# Altium schematic sheet DEMOD_FILTERS.SchDoc
size A; SheetNumber: 4; SheetTotal: 9
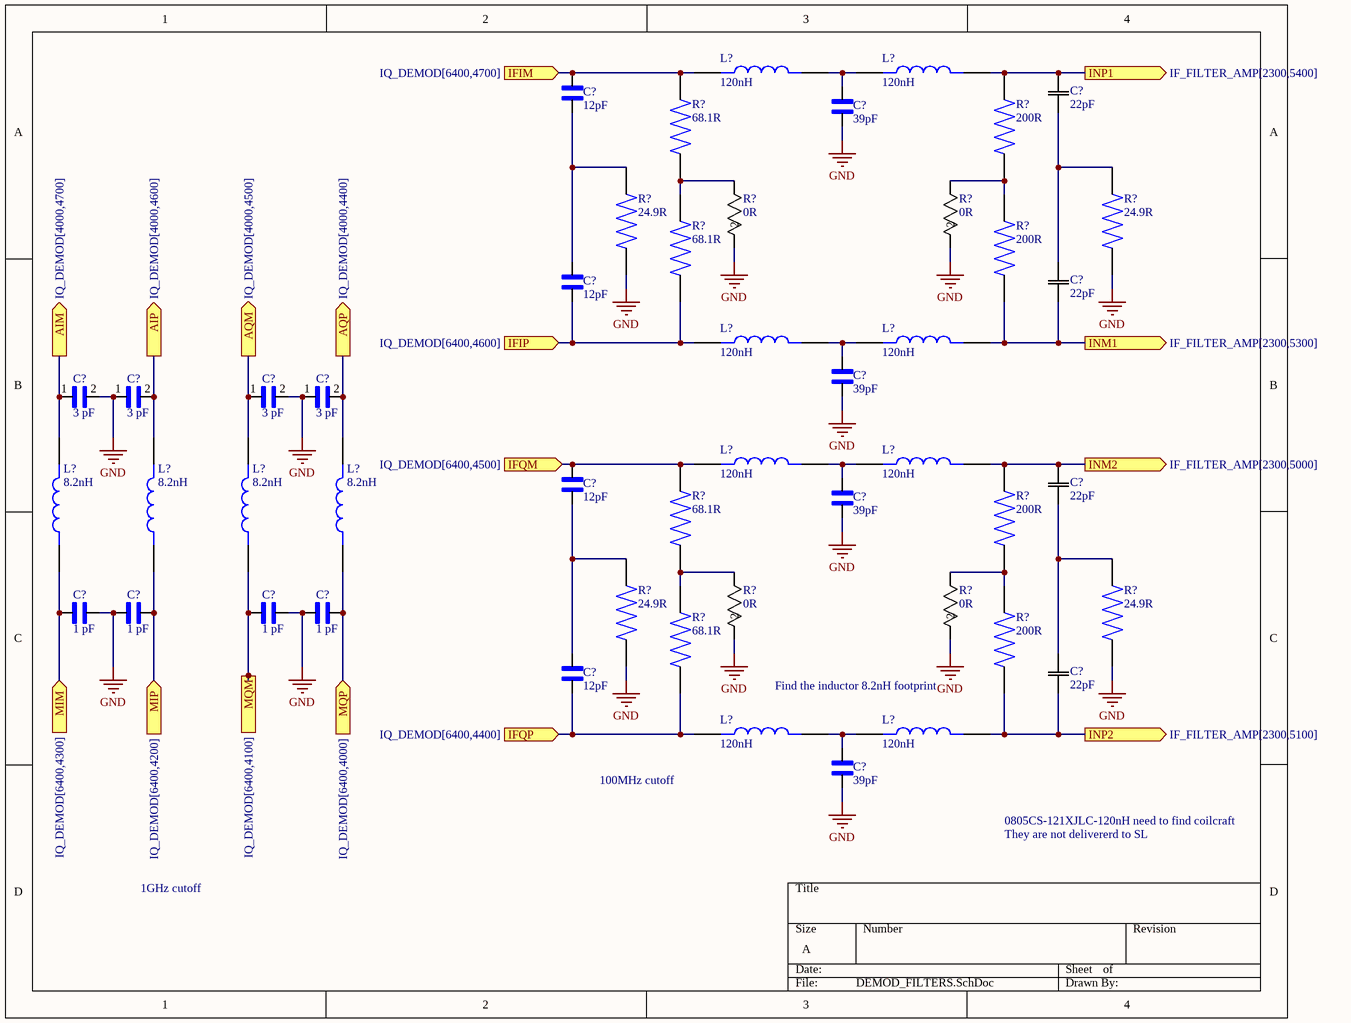
[diagram p0: DEMOD_FILTERS.SchDoc]

## Parts
(Parts that share a designator on the sheet are numbered #1, #2 ... from top to bottom, then left to right.)
C?#1  12pF  [CAPC1005X55N]
C?#2  39pF  [CAPC1005X55N]
C?#3  22pF  [G-155_MUR]
C?#4  12pF  [CAPC1005X55N]
C?#5  22pF  [G-155_MUR]
C?#6  39pF  [CAPC1005X55N]
C?#7  3 pF  [CAPC0603X33N]
C?#8  3 pF  [CAPC0603X33N]
C?#9  3 pF  [CAPC0603X33N]
C?#10  3 pF  [CAPC0603X33N]
C?#11  12pF  [CAPC1005X55N]
C?#12  39pF  [CAPC1005X55N]
C?#13  22pF  [G-155_MUR]
C?#14  1 pF  [CAPC0603X33N]
C?#15  1 pF  [CAPC0603X33N]
C?#16  1 pF  [CAPC0603X33N]
C?#17  1 pF  [CAPC0603X33N]
C?#18  12pF  [CAPC1005X55N]
C?#19  22pF  [G-155_MUR]
C?#20  39pF  [CAPC1005X55N]
L?#1  120nH
L?#2  120nH
L?#3  120nH
L?#4  120nH
L?#5  120nH
L?#6  120nH
L?#7  8.2nH
L?#8  8.2nH
L?#9  8.2nH
L?#10  8.2nH
L?#11  120nH
L?#12  120nH
R?#1  68.1R  [RESC1005X40N]
R?#2  200R  [RESC1005X40N]
R?#3  24.9R  [RESC1005X40N]
R?#4  24.9R  [RESC1005X40N]
R?#5  68.1R  [RESC1005X40N]
R?#6  0R  [RC0402N_PAN]
R?#7  0R  [RC0402N_PAN]
R?#8  200R  [RESC1005X40N]
R?#9  68.1R  [RESC1005X40N]
R?#10  200R  [RESC1005X40N]
R?#11  24.9R  [RESC1005X40N]
R?#12  24.9R  [RESC1005X40N]
R?#13  68.1R  [RESC1005X40N]
R?#14  0R  [RC0402N_PAN]
R?#15  0R  [RC0402N_PAN]
R?#16  200R  [RESC1005X40N]

## Ports
AIM (out, see IQ_DEMOD[4000,4700]), AIP (out, see IQ_DEMOD[4000,4600]), AQM (out, see IQ_DEMOD[4000,4500]), AQP (out, see IQ_DEMOD[4000,4400]), IFIM (in, see IQ_DEMOD[6400,4700]), IFIP (in, see IQ_DEMOD[6400,4600]), IFQM (in, see IQ_DEMOD[6400,4500]), IFQP (in, see IQ_DEMOD[6400,4400]), INM1 (out, see IF_FILTER_AMP[2300,5300]), INM2 (out, see IF_FILTER_AMP[2300,5000]), INP1 (out, see IF_FILTER_AMP[2300,5400]), INP2 (out, see IF_FILTER_AMP[2300,5100]), MIM (in, see IQ_DEMOD[6400,4300]), MIP (in, see IQ_DEMOD[6400,4200]), MQM (in, see IQ_DEMOD[6400,4100]), MQP (in, see IQ_DEMOD[6400,4000])

## Nets
GND: C?#2.1 C?#6.1 C?#7.2 C?#8.1 C?#9.2 C?#10.1 C?#12.1 C?#14.2 C?#15.1 C?#16.2 C?#17.1 C?#20.1 R?#3.1 R?#4.1 R?#6.2 R?#7.2 R?#11.1 R?#12.1 R?#14.2 R?#15.2
AIM: C?#7.1 L?#7.2 ; port AIM
AIP: C?#8.2 L?#8.2 ; port AIP
AQM: C?#9.1 L?#9.2 ; port AQM
AQP: C?#10.2 L?#10.2 ; port AQP
IFIM: C?#1.2 L?#1.1 R?#1.2 ; port IFIM
IFIP: C?#4.1 L?#3.1 R?#5.1 ; port IFIP
IFQM: C?#11.2 L?#5.1 R?#9.2 ; port IFQM
IFQP: C?#18.1 L?#11.1 R?#13.1 ; port IFQP
INM1: C?#5.1 L?#4.2 R?#8.1 ; port INM1
INM2: C?#13.2 L?#6.2 R?#10.2 ; port INM2
INP1: C?#3.2 L?#2.2 R?#2.2 ; port INP1
INP2: C?#19.1 L?#12.2 R?#16.1 ; port INP2
MIM: C?#14.1 L?#7.1 ; port MIM
MIP: C?#15.2 L?#8.1 ; port MIP
MQM: C?#16.1 L?#9.1 ; port MQM
MQP: C?#17.2 L?#10.1 ; port MQP
NetC?#1_1: C?#1.1 C?#4.2 R?#3.2
NetC?#2_2: C?#2.2 L?#1.2 L?#2.1
NetC?#3_1: C?#3.1 C?#5.2 R?#4.2
NetC?#6_2: C?#6.2 L?#3.2 L?#4.1
NetC?#11_1: C?#11.1 C?#18.2 R?#11.2
NetC?#12_2: C?#12.2 L?#5.2 L?#6.1
NetC?#13_1: C?#13.1 C?#19.2 R?#12.2
NetC?#20_2: C?#20.2 L?#11.2 L?#12.1
NetR?#1_1: R?#1.1 R?#5.2 R?#6.1
NetR?#2_1: R?#2.1 R?#7.1 R?#8.2
NetR?#9_1: R?#9.1 R?#13.2 R?#14.1
NetR?#10_1: R?#10.1 R?#15.1 R?#16.2

## Notes on the sheet
- Find the inductor 8.2nH footprint
- 100MHz cutoff
- 0805CS-121XJLC-120nH need to find coilcraft
- They are not delivererd to SL
- 1GHz cutoff

## Library data of the parts
C?#1 C?#4 C?#11 C?#18 = GRM1555C1H120JA01D-12p: SMD Capacitor C0G(EIA) with Capacitance: 12pF Tol. 5%. Rated Voltage: 50Vdc; MF: Murata; SnapEDA_Link: https://www.snapeda.com/parts/GRM1555C1H120JA01D/Murata/view-part/?ref=snap; Package: 1005-2 Murata; Value: *; MP: GRM1555C1H120JA01D; Check_prices: https://www.snapeda.com/parts/GRM1555C1H120JA01D/Murata/view-part/?ref=eda
C?#2 C?#6 C?#12 C?#20 = GRM1555C1H390JA01D-39p: SMD Capacitor C0G(EIA) with Capacitance: 39pF Tol. 5%. Rated Voltage: 50Vdc; MF: Murata; SnapEDA_Link: https://www.snapeda.com/parts/GRM1555C1H390JA01D/Murata/view-part/?ref=snap; Package: 1005-2 Murata; Value: *; MP: GRM1555C1H390JA01D; Check_prices: https://www.snapeda.com/parts/GRM1555C1H390JA01D/Murata/view-part/?ref=eda
C?#3 C?#5 C?#13 C?#19 = GRM1555C1H220JA01D-22p: Description; Manufacturer_Name: Murata; Copyright: Copyright (C) 2026 Ultra Librarian. All rights reserved.; Manufacturer_Part_Number: GRM1555C1H220JA01D
C?#7-C?#10 = GRM0335C1H3R0BA01D-3p: SMD capacitor C0G(EIA) with capacitance 3.0pF Tol.0.1pF. Rated voltage 50Vdc 125C; MF: Murata; SnapEDA_Link: https://www.snapeda.com/parts/GRM0335C1H3R0BA01D/Murata/view-part/?ref=snap; Purchase-URL: https://pricing.snapeda.com/search/part/GRM0335C1H3R0BA01D/?ref=eda; MP: GRM0335C1H3R0BA01D; Value: *; Package: 0603 Taiyo Yuden; Digi-Key_Part_Number: 490-11327-1-ND; Check_prices: https://www.snapeda.com/parts/GRM0335C1H3R0BA01D/Murata/view-part/?ref=eda
C?#14-C?#17 = GRM0335C1H1R0BA01J-1p: SMD capacitor C0G(EIA) with capacitance 1.0pF Tol.0.1pF. Rated voltage 50Vdc 125C; MF: Murata; SnapEDA_Link: https://www.snapeda.com/parts/GRM0335C1H1R0BA01J/Murata/view-part/?ref=snap; Package: 0603 Murata; Value: *; MP: GRM0335C1H1R0BA01J; Check_prices: https://www.snapeda.com/parts/GRM0335C1H1R0BA01J/Murata/view-part/?ref=eda
L?#1-L?#6 L?#11 L?#12 = 0805CS-121XJLC-120nH: MP: 0603CS-18NXJRW; Package: None; Price: None; Value: *; Availability: Unavailable
L?#7-L?#10 = 0805CS-080XJRC-8.2nH: MP: 0603CS-18NXJRW; Package: None; Price: None; Value: *; Availability: Unavailable
R?#1 R?#5 R?#9 R?#13 = RC0402FR-0768R1L-68.1R: 68.1 Ohms Â±1% 0.063W, 1/16W Chip Resistor 0402 (1005 Metric) Moisture Resistant Thick Film; MF: Yageo; SnapEDA_Link: https://www.snapeda.com/parts/RC0402FR-0768R1L/Yageo/view-part/?ref=snap; Package: 1005 Panasonic Electronic Components; Value: *; MP: RC0402FR-0768R1L; Check_prices: https://www.snapeda.com/parts/RC0402FR-0768R1L/Yageo/view-part/?ref=eda
R?#2 R?#8 R?#10 R?#16 = RC0402FR-07200RP-200R: 200 Ohms Â±1% 0.063W, 1/16W Chip Resistor 0402 (1005 Metric) Moisture Resistant Thick Film; MF: Yageo; SnapEDA_Link: https://www.snapeda.com/parts/RC0402FR-07200RP/Yageo/view-part/?ref=snap; Package: 1005 Panasonic Electronic Components; Value: *; MP: RC0402FR-07200RP; Check_prices: https://www.snapeda.com/parts/RC0402FR-07200RP/Yageo/view-part/?ref=eda
R?#3 R?#4 R?#11 R?#12 = RC0402FR-0724R9P-24.9R: RES SMD 24.9 OHM 1% 1/16W 0402; Package: None; Price: None; Value: *; MP: RC0402FR-0724R9P; Availability: Unavailable
R?#6 R?#7 R?#14 R?#15 = ERJ-2GE0R00X-0R: RESISTOR; 0402; 0 OHM; 0%; JUMPER; 0.10W; THICK FILM; Manufacturer_Name: Panasonic; Copyright: Copyright (C) 2025 Ultra Librarian. All rights reserved.; Manufacturer_Part_Number: ERJ-2GE0R00X